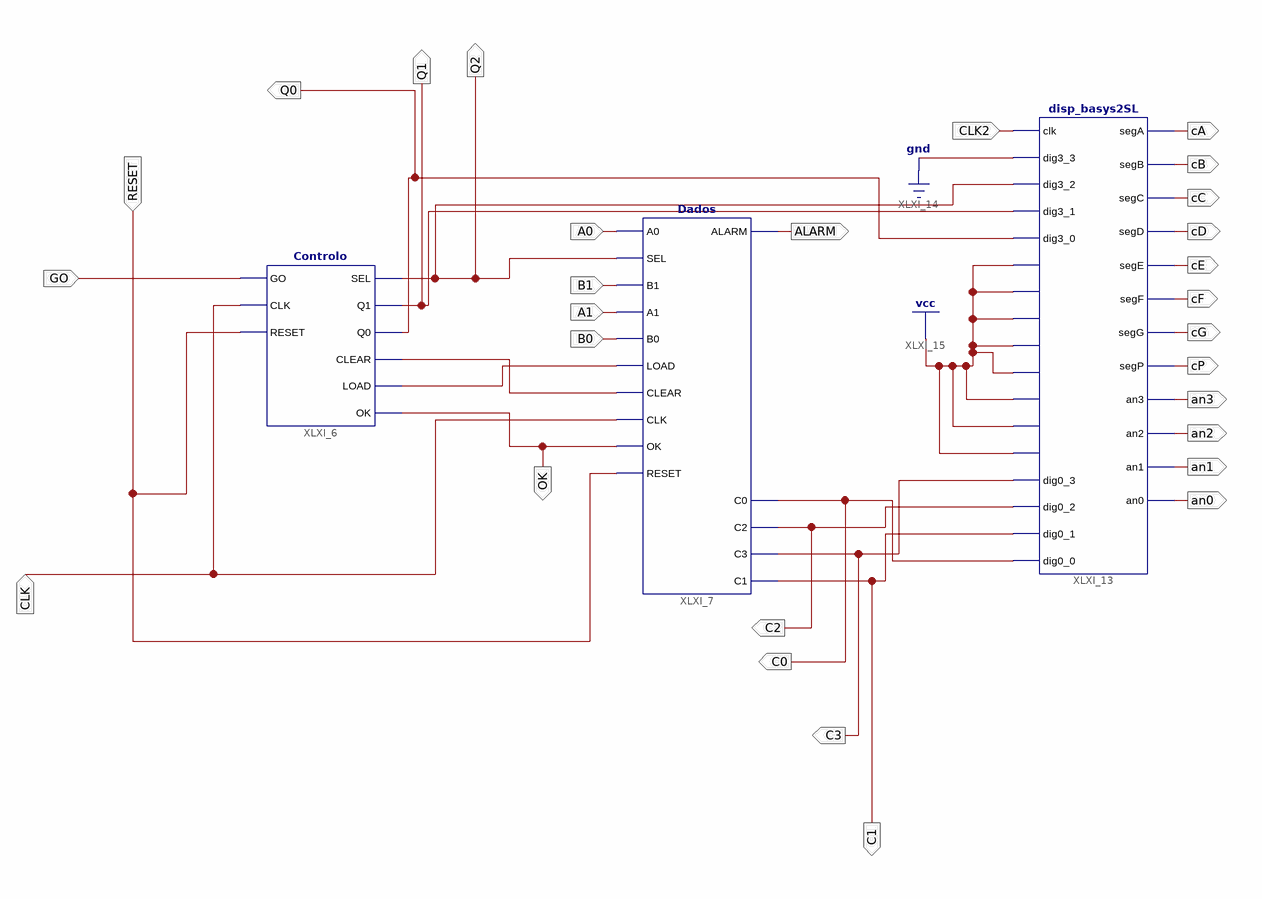
[diagram p0: schematic sheet 1]
// Xilinx ISE schematic Project.sch (spartan3e) as structural Verilog: 3 symbols, 29 ports
module Project (
  input  RESET,
  input  CLK,
  input  GO,
  input  A0,
  input  B1,
  input  A1,
  input  B0,
  input  CLK2,
  output ALARM,
  output Q2,
  output OK,
  output cA,
  output cB,
  output cC,
  output cD,
  output cE,
  output cF,
  output cG,
  output cP,
  output an3,
  output an2,
  output an1,
  output an0,
  output Q1,
  output Q0,
  output C0,
  output C3,
  output C2,
  output C1
);

  wire XLXN_68, XLXN_69;

  Controlo XLXI_6 (
    .CLEAR(XLXN_68), .CLK(CLK), .GO(GO), .LOAD(XLXN_69), .OK(OK), .Q0(Q0), .Q1(Q1), .RESET(RESET), .SEL(Q2));
  Dados XLXI_7 (
    .A0(A0), .SEL(Q2), .B1(B1), .A1(A1), .B0(B0), .LOAD(XLXN_69), .CLEAR(XLXN_68), .CLK(CLK), .OK(OK),
    .RESET(RESET), .ALARM(ALARM), .C0(C0), .C2(C2), .C3(C3), .C1(C1));
  disp_basys2SL XLXI_13 (
    .clk(CLK2), .dig3_3(1'b0), .dig3_2(Q2), .dig3_1(Q1), .dig3_0(Q0), .dig2_3(1'b1), .dig2_2(1'b1),
    .dig2_1(1'b1), .dig2_0(1'b1), .dig1_3(1'b1), .dig1_2(1'b1), .dig1_1(1'b1), .dig1_0(1'b1), .dig0_3(C3),
    .dig0_2(C2), .dig0_1(C1), .dig0_0(C0), .segA(cA), .segB(cB), .segC(cC), .segD(cD), .segE(cE), .segF(cF),
    .segG(cG), .segP(cP), .an3(an3), .an2(an2), .an1(an1), .an0(an0));
endmodule
